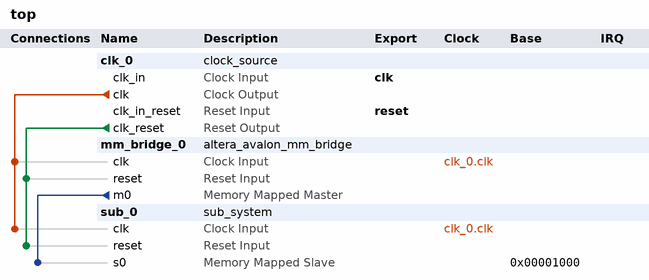
[diagram p0: system contents]
# Platform Designer (Qsys) system top
# Parameters at their usual value, and those the tool derives, are not listed.
package require -exact qsys 18.1
create_system top
set_project_property DEVICE_FAMILY {Cyclone V}

add_instance clk_0 clock_source 18.1
set_instance_parameter_value clk_0 clockFrequency 50000000

add_instance mm_bridge_0 altera_avalon_mm_bridge 18.1
set_instance_parameter_value mm_bridge_0 DATA_WIDTH 32

add_instance sub_0 sub_system 1.0

# connections
add_connection clk_0.clk mm_bridge_0.clk clock
add_connection clk_0.clk sub_0.clk clock
add_connection clk_0.clk_reset mm_bridge_0.reset reset
add_connection clk_0.clk_reset sub_0.reset reset
add_connection mm_bridge_0.m0 sub_0.s0 avalon
set_connection_parameter_value mm_bridge_0.m0/sub_0.s0 baseAddress 0x00001000

# exported interfaces
add_interface clk clock sink
set_interface_property clk EXPORT_OF clk_0.clk_in
add_interface reset reset sink
set_interface_property reset EXPORT_OF clk_0.clk_in_reset

save_system top.qsys
